# Altium schematic sheet sheet1_rc_templates.SchDoc
size 431 x 279 mm; SheetNumber: 1; SheetTotal: 2; ENG_APP_DATE: --/--/--; DSN_APP_DATE: --/--/--; CHK_APP_DATE: --/--/--
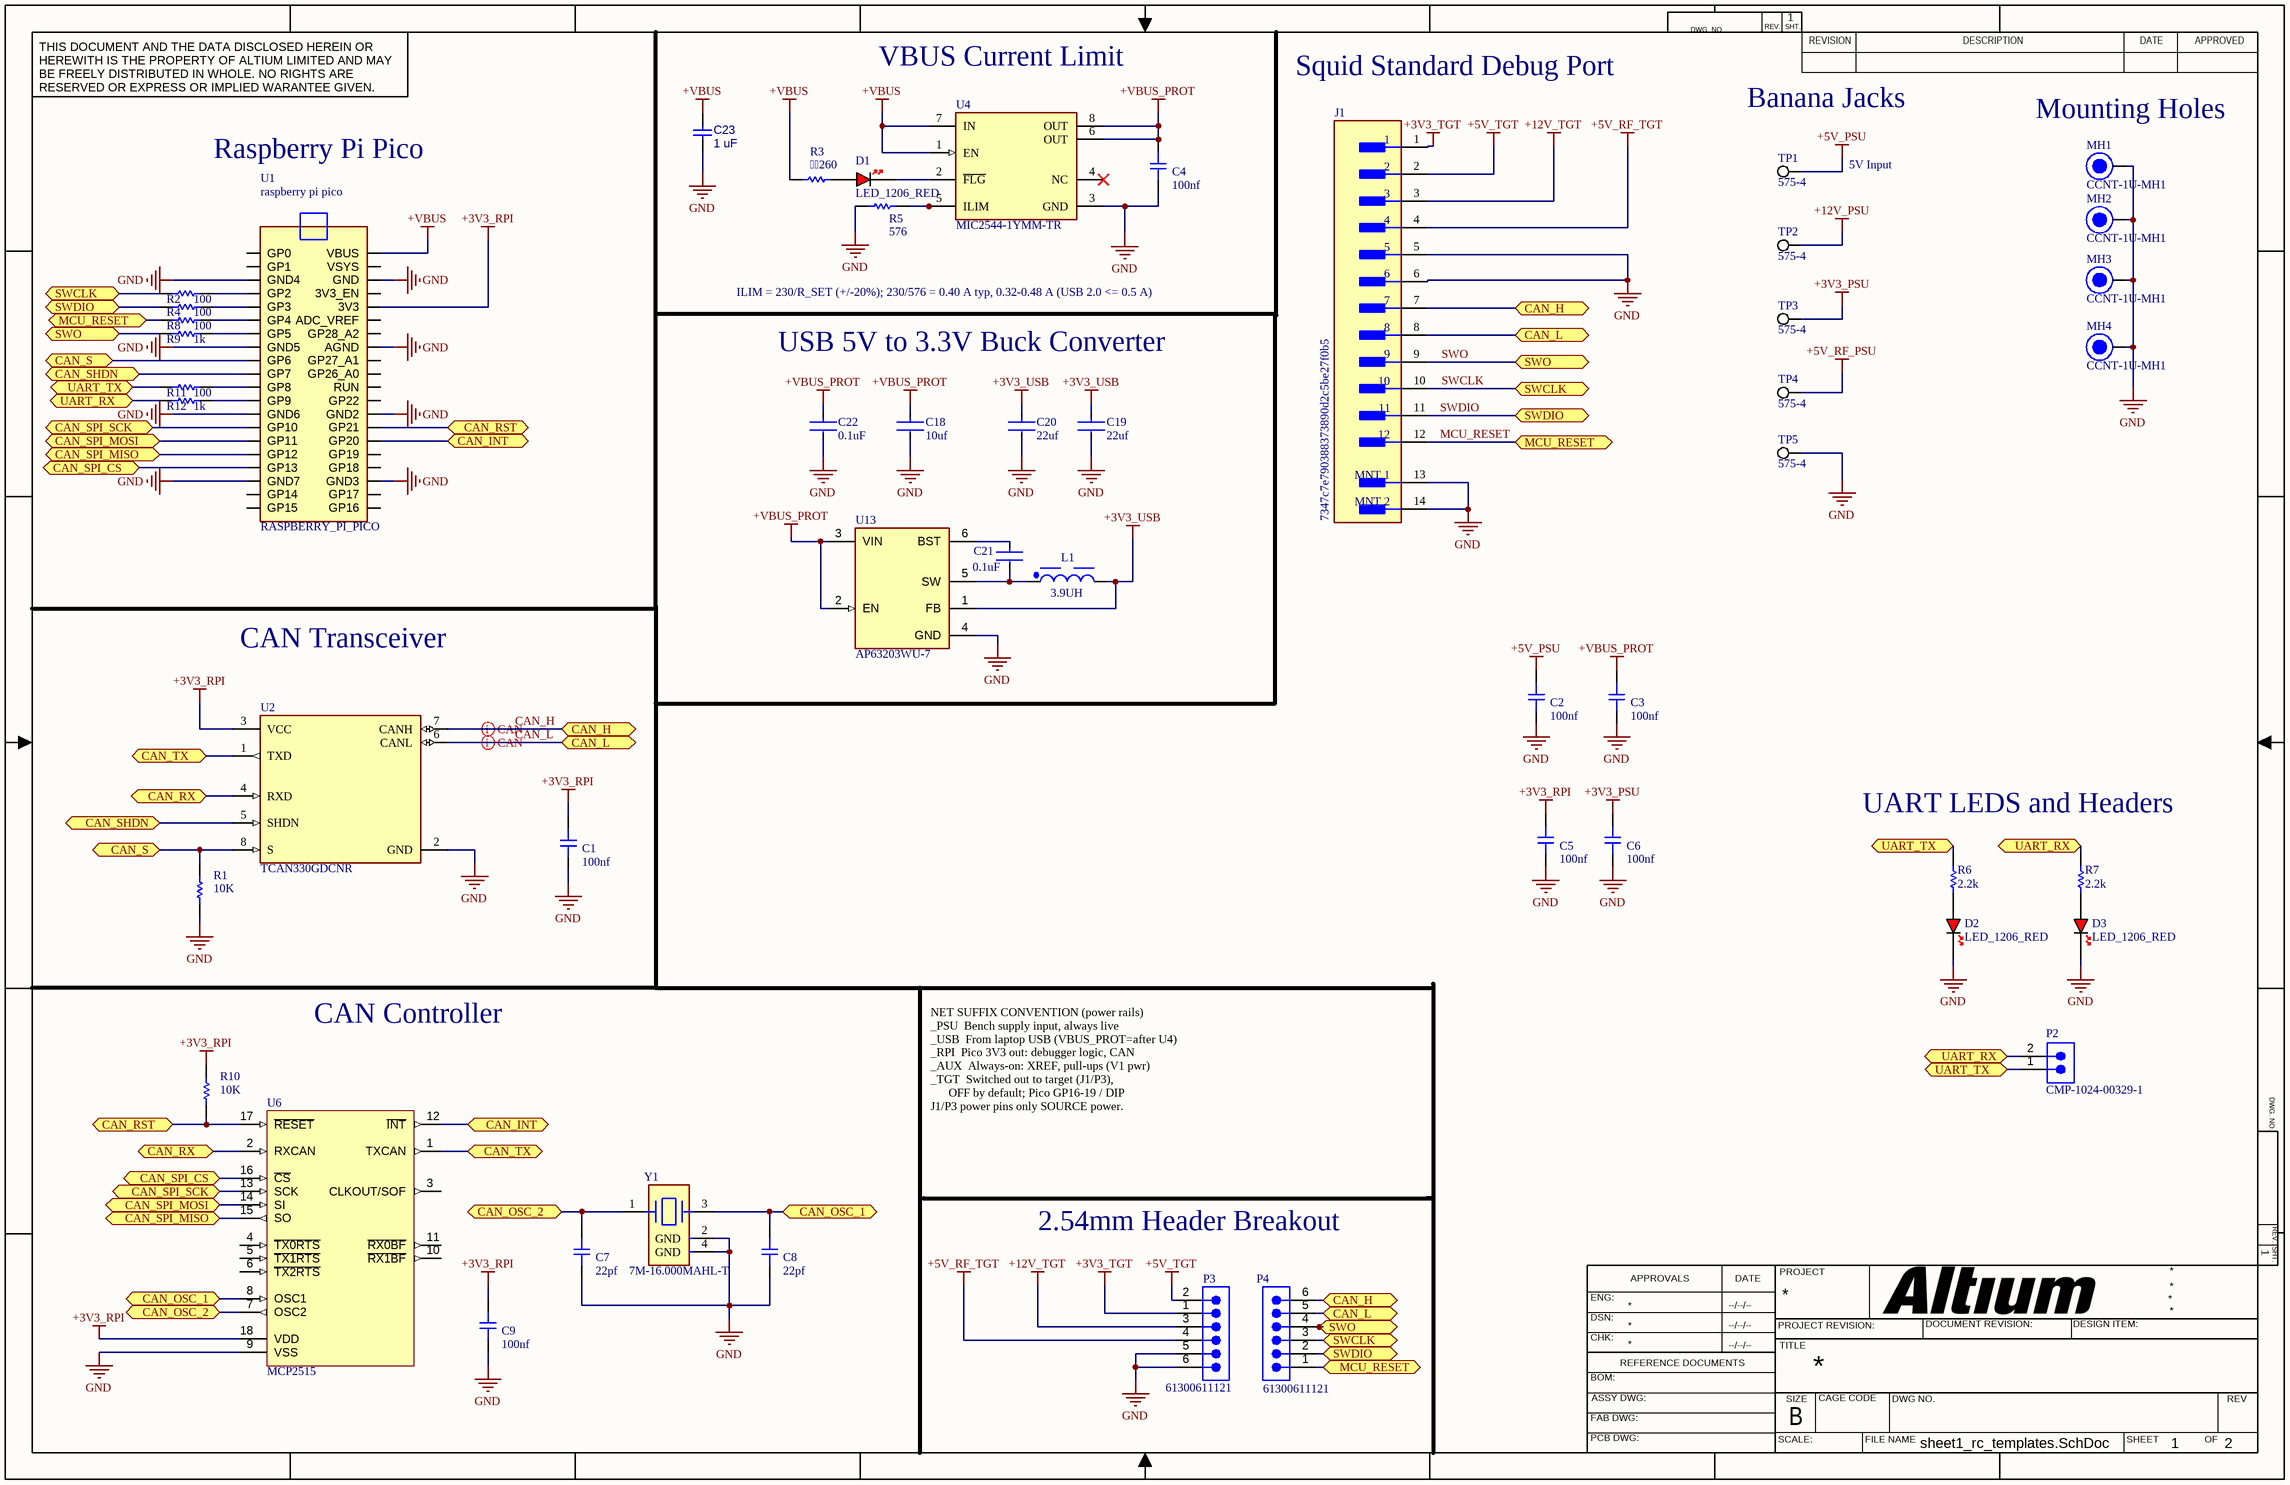
[diagram p0: sheet1_rc_templates.SchDoc]

## Parts
C1  100nf  [CAP_0805]
C2  100nf  [CAP_0805]
C3  100nf  [CAP_0805]
C4  100nf  [CAP_0805]
C5  100nf  [CAP_0805]
C6  100nf  [CAP_0805]
C7  22pf  [CAP_0805]
C8  22pf  [CAP_0805]
C9  100nf  [CAP_0805]
C18  10uf  [FP-CGA5L-0_3-0_1-IPC_A]
C19  22uf  [FP-GCM31C-0_2-e0_3_0_8-IPC_A]
C20  22uf  [FP-GCM31C-0_2-e0_3_0_8-IPC_A]
C21  0.1uF  [FP-C0805C-DN-MFG]
C22  0.1uF  [FP-C0805C-DN-MFG]
C23  1 uF  [CAPC2013X145X50ML20T25]
D1  LED_1206_RED  [LED_1206_RED]
D2  LED_1206_RED  [LED_1206_RED]
D3  LED_1206_RED  [LED_1206_RED]
J1  7347c7e790388373890d2c5be27f0b5  [FP-BM12B-GHS-TBT_LF_SN-MFG]
L1  3.9UH  [WE-PD2SR_7850]
MH1  CCNT-1U-MH1  [CCNT-1U-MH1-Footprint-1]
MH2  CCNT-1U-MH1  [CCNT-1U-MH1-Footprint-1]
MH3  CCNT-1U-MH1  [CCNT-1U-MH1-Footprint-1]
MH4  CCNT-1U-MH1  [CCNT-1U-MH1-Footprint-1]
P2  CMP-1024-00329-1  [SMTC-TSW-102-26-XX-S]
P3  61300611121  [61300611121]
P4  61300611121  [61300611121]
R1  10K  [RES_0805]
R2  100  [RES_0805]
R3  260  [RES_0805]
R4  100  [RES_0805]
R5  576  [RES_0805]
R6  2.2k  [RES_0805]
R7  2.2k  [RES_0805]
R8  100  [RES_0805]
R9  1k  [RES_0805]
R10  10K  [RES_0805]
R11  100  [RES_0805]
R12  1k  [RES_0805]
TP1  575-4  [KSTN-575-4]
TP2  575-4  [KSTN-575-4]
TP3  575-4  [KSTN-575-4]
TP4  575-4  [KSTN-575-4]
TP5  575-4  [KSTN-575-4]
U1  RASPBERRY_PI_PICO  [RASPBERRY_PI_PICO]
U2  TCAN330GDCNR  [FP-DCN0008A-MFG]
U4  MIC2544-1YMM-TR  [FP-MSOP-8LD-PL-1-MFG]
U6  MCP2515  [SOIC-SO18_M]
U13  AP63203WU-7  [FP-TSOT26-MFG]
Y1  7M-16.000MAHL-T  [FP-7M-MFG]

## Ports
CAN_H (bidir), CAN_INT (bidir), CAN_L (bidir), CAN_OSC_1 (bidir), CAN_OSC_2 (bidir), CAN_RST (bidir), CAN_RX (bidir), CAN_S (bidir), CAN_SHDN (bidir), CAN_SPI_CS (bidir), CAN_SPI_MISO (bidir), CAN_SPI_MOSI (bidir), CAN_SPI_SCK (bidir), CAN_TX (bidir), MCU_RESET (bidir), SWCLK (bidir), SWDIO (bidir), SWO (bidir), UART_RX (bidir), UART_TX (bidir)

## Nets
+3V3_PSU: C6.2 TP3.1
+3V3_RPI: C1.2 C5.2 C9.2 R10.2 U1.3V3 U2.3(VCC) U6.18(VDD)
+3V3_TGT: J1.1 P3.1
+3V3_USB: C19.1 C20.1 L1.2 U13.1(FB)
+5V_PSU: C2.2 TP1.1
+5V_RF_PSU: TP4.1
+5V_RF_TGT: J1.4 P3.4
+5V_TGT: J1.2 P3.2
+12V_PSU: TP2.1
+12V_TGT: J1.3 P3.3
+VBUS: C23.1 R3.2 U1.VBUS U4.1(EN) U4.7(IN)
+VBUS_PROT: C3.2 C4.2 C18.1 C22.1 U4.6(OUT) U4.8(OUT) U13.2(EN) U13.3(VIN)
GND: C1.1 C2.1 C3.1 C4.1 C5.1 C6.1 C7.1 C8.1 C9.1 C18.2 C19.2 C20.2 C22.2 C23.2 D2.K D3.K J1.5 J1.6 J1.13(MNT_1) J1.14(MNT_2) MH1.MH1 MH2.MH1 MH3.MH1 MH4.MH1 P3.5 P3.6 R1.1 R5.2 TP5.1 U1.AGND U1.GND U1.GND2 U1.GND3 U1.GND4 U1.GND5 U1.GND6 U1.GND7 U2.2(GND) U4.3(GND) U6.9(VSS) U13.4(GND) Y1.2(GND) Y1.4(GND)
CAN_H: J1.7 P4.6 U2.7(CANH) ; port CAN_H
CAN_INT: U1.GP20 U6.12(~{INT}) ; port CAN_INT
CAN_L: J1.8 P4.5 U2.6(CANL) ; port CAN_L
CAN_OSC_1: C8.2 U6.8(OSC1) Y1.3 ; port CAN_OSC_1
CAN_OSC_2: C7.2 U6.7(OSC2) Y1.1 ; port CAN_OSC_2
CAN_RST: R10.1 U1.GP21 U6.17(~{RESET}) ; port CAN_RST
CAN_RX: U2.4(RXD) U6.2(RXCAN) ; port CAN_RX
CAN_S: R1.2 U1.GP6 U2.8(S) ; port CAN_S
CAN_SHDN: U1.GP7 U2.5(SHDN) ; port CAN_SHDN
CAN_SPI_CS: U1.GP13 U6.16(~{CS}) ; port CAN_SPI_CS
CAN_SPI_MISO: U1.GP12 U6.15(SO) ; port CAN_SPI_MISO
CAN_SPI_MOSI: U1.GP11 U6.14(SI) ; port CAN_SPI_MOSI
CAN_SPI_SCK: U1.GP10 U6.13(SCK) ; port CAN_SPI_SCK
CAN_TX: U2.1(TXD) U6.1(TXCAN) ; port CAN_TX
MCU_RESET: J1.12 P4.1 R8.2 ; port MCU_RESET
SWCLK: J1.10 P4.3 R2.2 ; port SWCLK
SWDIO: J1.11 P4.2 R4.2 ; port SWDIO
SWO: J1.9 P4.4 R9.2 ; port SWO
UART_RX: P2.2 R7.2 R12.2 ; port UART_RX
UART_TX: P2.1 R6.2 R11.2 ; port UART_TX
NetC21_1: C21.1 U13.6(BST)
NetC21_2: C21.2 L1.1 U13.5(SW)
NetD1_A: D1.A R3.1
NetD1_K: D1.K U4.2(~{FLG})
NetD2_A: D2.A R6.1
NetD3_A: D3.A R7.1
NetR2_1: R2.1 U1.GP2
NetR4_1: R4.1 U1.GP3
NetR5_1: R5.1 U4.5(ILIM)
NetR8_1: R8.1 U1.GP4
NetR9_1: R9.1 U1.GP5
NetR11_1: R11.1 U1.GP8
NetR12_1: R12.1 U1.GP9

Not connected (* = marked no-connect by the designer): U1 3V3_EN ADC_VREF GP0 GP1 GP14 GP15 GP16 GP17 GP18 GP19 GP22 GP26_A0 GP27_A1 GP28_A2 RUN VSYS; U4 4(NC)*; U6 3(CLKOUT/SOF) 4(~{TX0RTS}) 5(~{TX1RTS}) 6(~{TX2RTS}) 10(~{RX1BF}) 11(~{RX0BF})

## Layout directives
differential pair: CAN_H, CAN_L

## Notes on the sheet
- VBUS Current Limit
- Squid Standard Debug Port
- Raspberry Pi Pico
- Banana Jacks
- 5V Input
- (near MH1) Mounting Holes
- ILIM = 230/R_SET (+/-20%); 230/576 = 0.40 A typ, 0.32-0.48 A (USB 2.0 <= 0.5 A)
- USB 5V to 3.3V Buck Converter
- CAN Transceiver
- UART LEDS and Headers
- CAN Controller
- NET SUFFIX CONVENTION (power rails)
  _PSU  Bench supply input, always live
  _USB  From laptop USB (VBUS_PROT=after U4)
  _RPI  Pico 3V3 out: debugger logic, CAN
  _AUX  Always-on: XREF, pull-ups (V1 pwr)
  _TGT  Switched out to target (J1/P3),
  OFF by default; Pico GP16-19 / DIP
  J1/P3 power pins only SOURCE power.
- 2.54mm Header Breakout
- DWG. NO.
- REV.
- SHT.
- THIS DOCUMENT AND THE DATA DISCLOSED HEREIN OR HEREWITH IS THE PROPERTY OF ALTIUM LIMITED AND MAY BE FREELY DISTRIBUTED IN WHOLE. NO RIGHTS ARE RESERVED OR EXPRESS OR IMPLIED WARANTEE GIVEN.
- REVISION
- DESCRIPTION
- DATE
- APPROVED
- ENG:
- APPROVALS
- PROJECT
- DSN:
- CHK:
- REFERENCE DOCUMENTS
- PROJECT REVISION:
- TITLE
- DOCUMENT REVISION:
- DESIGN ITEM:
- BOM:
- FAB DWG:
- PCB DWG:
- ASSY DWG:
- SCALE:
- SIZE
- B
- CAGE CODE
- FILE NAME
- DWG NO.
- SHEET
- OF
- REV
- (in symbol CMP-204-000001-1) raspberry pi pico

## Library data of the parts
C1-C9 = CMP-001-00121-1: Capacitor SMD 0805 - Generic; Source: Generic_Schematic_Library.SchLib; Design Item ID: CAP_0805
C18 = CMP-08246-002111-1: Cap Ceramic 10uF 35V X7R 10% Pad SMD 1206 +125°C Automotive T/R; Height: 1.6mm; Thickness: 0.075inch; Tolerance: 10%; Voltage Rating (DC): 35V; Min Operating Temperature: -55°C; Width: 0.063inch; Ratings: AEC-Q200; Dielectric: X7R; Voltage Rating: 35V; REACH SVHC: No SVHC; Case Code (Imperial): 1206; Features: Soft Termination; Mount: Surface Mount; Case Code (Metric): 3216; Lead Free: Lead Free; Length: 0.126inch; Package Quantity: 2000; Packaging: Tape and Reel; Case/Package: 1206; Capacitance: 10uF; Max Operating Temperature: 125°C; Weight: 0.000571oz; Termination: SMD/SMT
C19 C20 = CMP-06035-059468-1: Ceramic Capacitor for Automotive 22uF ±10% 10VDC X7R 1206 Embossed T/R
C21 C22 = CMP-03020-000950-1: CAP CER 0.1UF 50V X7R 0805; Manufacturer: KEMET; Manufacturer Part Number: C0805C104J5RACTU; Temperature Coefficient: 30ppm/°C; Value: 0.10 μF; Material: Ceramic; Tolerance: 0.05; Voltage Rating: 50 V; Digikey Description: CAP CER 0.1UF 50V X7R 0805; Octopart: https://octopart.com/c0805c104j5ractu-kemet-104634; RoHS: TRUE; Device Class L1: Passive Components; Temperature Characteristic: X7R; Device Class L3: Ceramic Capacitors; Lead Free: Yes; Automotive: No; Category: Cap; Temperature: -55°C to +125°C; Package: C0805C-DN; Temperature Range High: +125°C; Height: 0.88mm; Capacitance: 0.10 μF; Temperature Range Low: -55°C; ComponentLink2Description: Datasheet; ComponentLink2URL: https://content.kemet.com/datasheets/KEM_C1003_C0G_SMD.pdf; Ipc Land Pattern Name: CAPC200125X78; Device Class L2: Capacitors; Mouser Description: Multilayer Ceramic Capacitors MLCC - SMD/SMT 50volts 0.1uF X7R 5%
C23 = CMP-001-00010-9: Chip Capacitor, 1 uF, +/-10%, 25 V, 0805 (2012 Metric); Voltage Rating: 25V; Value: 1µF; Tolerance: 10%; Capacitor Type: Ceramic; Min Operating Temperature: -55°C; Max Operating Temperature: 125°C; Pins: 2; Mounting Technology: SM; RoHS Compliant: True; Case/Package: 0805
D1-D3 = CMP-004-00077-1: LED 1206 RED SMD; Source: Generic_Schematic_Library.SchLib; Design Item ID: LED_1206_RED
J1 = CMP-002-00170-1: CONN HEADER SMD 12POS 1.25MM; Current Rating: 1A; Number Of Contacts: 12; Voltage Rating (AC): 50V; Wire/Cable Gauge: 26AWG; Orientation: Straight; Reach SVHC Compliant: Yes; Contact Material: Bronze; Source: SquidSat Deployable Antenna REV1_1.SCHLIB; Packaging: Cut Tape; Termination: SMD/SMT; Number of Rows: 1; Min Operating Temperature: -25°C; Mount: Surface Mount; Pitch: 1.25mm; Housing Material: Nylon; Number of Positions: 12; Voltage Rating: 50V; Housing Color: Natural; Max Operating Temperature: 85°C; Lead Free: Lead Free; Contact Plating: Tin; Series: GH; Design Item ID: 7347c7e790388373890d2c5be27f0b5
L1 = CMP-1397-00011-3: Fixed Ind 3.9UH 3.8A 20 Mohm SMD; Core Material: Composite, Ferrite; Inductance: 3.9µH; Series Resistance: 16.7mΩ; Tolerance: 30%; Test Frequency: 100kHz; Shielding: Shielded; Self Resonant Frequency: 45MHz; Saturation Current: 4A; Number of Pins: 2; Max Operating Temperature: 125°C; Mount: Surface Mount; Length: 7.8mm; DC Resistance (DCR): 16.7mΩ; Case/Package: SMD/SMT; Min Operating Temperature: -40°C; Width: 7mm; REACH SVHC: Unknown; RMS Current (Irms): 3.8A; Max DC Current: 3.8A; Composition: Wirewound; Termination: SMD/SMT; Inductance Tolerance: 30%; Ambient Temperature Range High: 85°C; Ambient Temperature Range Low: -40°C; Depth: 7mm; Height - Seated (Max): 4.4958mm; RoHS: Compliant; Height: 4.8mm; Current Rating: 3.8A
MH1-MH4 = CMP-002-00076-1: BOTTOM LEFT Mounting Hole for blank 1U CubeSat template used on CCNT
P2 = CMP-002-00166-1: 0.025" SQ Post Header, Through-hole, Vertical, -55 to 125 degC, 2.54 mm Pitch, 2-Pin, Male, RoHS; Manufacturer: Samtec; PartNumber: TSW-102-26-F-S; Available Preview Images: 2D; Pitch: 2.54 mm; ComponentLink1URL: http://www.samtec.com; Design Item ID: CMP-1024-00329-1; DatasheetVersion: F-214; Orientation: Vertical; Mounting Technology: Through-hole; ComponentLink2URL: http://www.samtec.com/documents/webfiles/pdf/TSW_TH.PDF; ComponentLink3URL: http://www.samtec.com/documents/webfiles/cpdf/TSW-XXX-XX-XXX-X-XX-XXX-MKT.pdf; ComponentLink2Description: Datasheet; Source: SquidSat Deployable Antenna REV1_1.SCHLIB; ComponentLink3Description: Package Specification; RoHS: True; Temperature Range: -55 to 125 degC; PackageVersion: DM, 8/1988; PackageReference: TSW-102-26-XX-S; PackageDescription: .025[0.64] SQ. Post Terminal Strip Assembly; ComponentLink1Description: Manufacturer URL
P3 P4 = CMP-1502-01070-4: THT Vertical Pin Header WR-PHD, Pitch 2.54 mm, Single Row, 6 pins; Pitch: 2.54mm; Operating Supply Voltage: 250V; Connector Type: Male Pin; Gender: Male; Number of Positions: 6; Contact Resistance: 20mΩ; Current Rating: 3A; Termination: Through Hole; Color: Black; Number of Pins: 6; Lead Pitch: 2.54mm; Height: 8.89mm; RoHS: Compliant; Lead Free: Lead Free; Contact Mating Length: 5.9944mm; Contact Plating: Gold; Contact Gender: Male; Packaging: Bulk; Orientation: Vertical; Mount: Through Hole; Voltage Rating: 250V; Number of Rows: 1; Max Operating Temperature: 105°C; Min Operating Temperature: -40°C; Housing Material: PBT; Contact Material: Gold; Number of Contacts: 6
R1-R12 = CMP-009-00183-1: Resistor SMD 0805 - Generic; Source: Generic_Schematic_Library.SchLib; Design Item ID: RES_0805
TP1-TP5 = CMP-2000-05649-1: Banana Jack, Non-Insulated, 1-Pin THD, RoHS, Bulk; Manufacturer: Keystone-Electronics; Package Version: Rev. B, 11/1994; Plug/Mating Plug Diameter: StandardBanana; Gender: Female; Package Reference: 575-4; Operating Temperature: -; Contact Material: Brass; Packaging: Bulk; Series: -; Category: Connectors,Interconnects; Color: -; Type: BananaJack; Contact Finish: Nickel; Features: -; Family: BananaandTipConnectors-Jacks,Plugs; Body Material: -; Manufacturer URL: http://www.keyelco.com/; Termination: Solder; Insulation: Non-Insulated; Datasheet Version: Rev. B, 11/1994; Mounting Technology: ThroughHole; Package URL: http://www.keyelco.com/product-pdf.cfm?p=2379; Mounting Type: ThroughHole; Package Description: 1-Pin Through Hole Device, Dia 7.92 mm; Datasheet URL: http://www.keyelco.com/product-pdf.cfm?p=2379; Wire Gauge: -
U1 = CMP-204-000001-1: Raspberry Pi Board, Arm Cortex-M0+; Core Architecture:Arm; Core Sub-Architecture:Cortex-M0+; Kit Contents:Raspberry Pi Pico Board; No. Of Bits:32Bit; Silicon Core Number:Rp2040; Silicon Manufacturer:Raspberry Pi; Value: U*; Component Type: Standard; Pin Count: 40; Design Item ID: RASPBERRY_PI_PICO; Source: RASPBERRY_PI_PICO.SchLib; MP: RASPBERRY PI PICO; Package: None; MF: Raspberry Pi; SnapEDA_Link: https://www.snapeda.com/parts/RASPBERRY%20PI%20PICO/Raspberry+Pi/view-part/?ref=snap; Check_prices: https://www.snapeda.com/parts/RASPBERRY%20PI%20PICO/Raspberry+Pi/view-part/?ref=eda
U2 = CMP-031-00060-1: IC TRANSCEIVER 1/1 SOT23-8; Data Rate: 1Mbps; Lead Free: Lead Free; Pin Count: 8; Mount: Surface Mount; Min Operating Temperature: -40°C; Packaging: Tape and Reel; Case/Package: SOT-23-8; Source: Squid FCR V0.SCHLIB; Component Type: Standard; Max Operating Temperature: 125°C; Design Item ID: CMP-04872-000178-1; RoHS Compliant: Yes
U4 = CMP-00008-1: IC SW CURR LIMIT HI SIDE 8-MSOP / USB Power Switch Single 5.5V 0.1A to 1.5A 8-Pin MSOP T/R; Manufacturer Lifecycle Status: REL; Fault Protection: Over Temperature; Output Configuration: High Side; Number of Outputs: 1; On-State Resistance: 120mΩ; Turn-Off Delay Time: 22µs; Value: 120mΩ; Nominal Supply Current: 5µA; Min Supply Voltage: 2.7V; Turn-On Delay Time: 2ms; RoHS: Compliant; Min Operating Temperature: -40°C; Current Rating: 1.5A; Max Operating Temperature: 125°C; Lifecycle Status: Production; Lead Free: Lead Free; Radiation Hardening: No; Max Supply Voltage: 5.5V; Schedule B: 8542390000, 8542390000; Case/Package: MSOP; Max Output current: 1.5A; Projected EOL Date: 2034-06-14; Ambient Temperature Range High: 85°C; Pins: 8; Country of Origin: Thailand; HS Code: 8542.39.0090; Number of Channels: 1; Mounting Technology: Surface Mount; Nominal Supply Voltage: 5.5V; Country of Fabrication: United States of America; Height: 1.1mm; Output Current: 1.5A; Export Control Classification Number (ECCN) Code: EAR99; Part Series: -; Country of Assembly: Thailand; Harmonized Tariff Schedule (HTS) Code: 8542.39.0060
U6 = CMP-330-000002-1: Stand-Alone CAN Controller With SPI Interface, 18-Pin SOIC, Extended Temperature; Design Item ID: CMP-0186-00035-2; ComponentLink1Description: Manufacturer URL; PackageDescription: 18-Lead Plastic Small Outline (SO) - Wide 7.50mm Body [SOIC]; Code_JEDEC: MS-013; PackageVersion: revBB, Aug-2009; Source: Squid FCR V0.SCHLIB; ComponentLink3URL: http://www.microchip.com/stellent/groups/techpub_sg/documents/packagingspec/en012702.pdf; DatasheetVersion: revF, Oct-2010; RevisionNote: URLs added. DatasheetVersion updated.; Component Type: Standard; Pin Count: 18; ComponentLink2URL: http://ww1.microchip.com/downloads/en/DeviceDoc/21801f.pdf; ComponentLink3Description: Package Specification; ComponentLink1URL: http://www.microchip.com/; PackageReference: SOIC-SO18; ComponentLink2Description: Datasheet
U13 = CMP-12757-000006-1: IC REG BUCK 3.3V 2A TSOT26; Manufacturer: Diodes Inc.; Output Type: Fixed; Min Supply Voltage: 3.8V; Number Of Outputs: 1; Max Junction Temp: +160°C; Nominal Supply Current: 22uA; Standoff Height: 0.01mm; Switching Frequency: 1.1MHz; Max Supply Voltage: 32V; ComponentLink2Description: Datasheet; Device Class L1: Integrated Circuits (ICs); Temperature: to +160°C; Device Class L3: Voltage Regulators - Switching; RoHS: TRUE; Octopart: https://octopart.com/ap63203wu-7-diodes+inc.-98099550; Output Voltage: 3.3V; Lead Free: Yes; ComponentLink2URL: https://www.diodes.com/assets/Datasheets/AP63200-AP63201-AP63203-AP63205.pdf; Digikey Description: IC REG BUCK 3.3V 2A TSOT26; Footprint Url: https://www.diodes.com/assets/Package-Files/TSOT26.pdf; Ambient Temperature Range High: +85°C; Height: 1mm; Automotive: No; Temperature Range High: +160°C; Switching Topology: Buck; Output Current: 2A; Package: TSOT26; Category: IC; Mouser Description: AP63203 Series 3.3 V 2 A SMT Fixed Low IQ Synchronous Buck - TSOT-26; Device Class L2: Power Management ICs; Ambient Temperature Range Low: -40°C; Manufacturer Part Number: AP63203WU-7
Y1 = CMP-003-00073-1: Crystal 16MHz, 30ppm, 22pF, 60O; ESR (Equivalent Series Resistance): 80; Pins: 4; Component Type: Standard; Min Operating Temperature: -40°C; Frequency: 16MHz; Frequency Stability: 30ppm; Max Operating Temperature: 85°C; Frequency Tolerance: 30ppm; Load Capacitance: 22pF; Design Item ID: CMP-18717-000072-1; Source: Squid FCR V0.SCHLIB